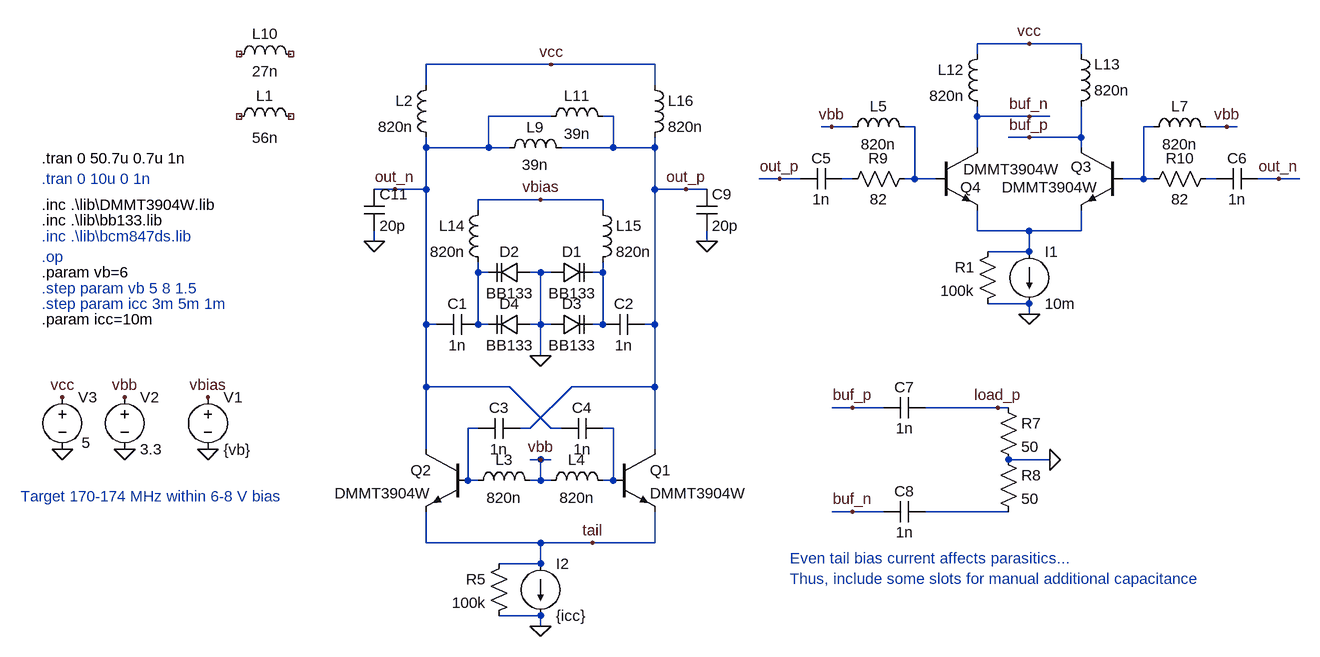
[diagram p0: schematic VHF_VCO_LO_circuit.asc]
VHF_VCO_LO_circuit.asc, the LTspice schematic file:
Version 4.1
SHEET 1 1676 680
WIRE 1120 -400 1040 -400
WIRE 1200 -400 1120 -400
WIRE 1040 -384 1040 -400
WIRE 1200 -384 1200 -400
WIRE 384 -368 192 -368
WIRE 544 -368 384 -368
WIRE 192 -336 192 -368
WIRE 544 -336 544 -368
WIRE 384 -288 288 -288
WIRE 480 -288 464 -288
WIRE 1040 -288 1040 -304
WIRE 1120 -288 1040 -288
WIRE 1152 -288 1120 -288
WIRE 816 -272 800 -272
WIRE 848 -272 816 -272
WIRE 944 -272 928 -272
WIRE 1312 -272 1296 -272
WIRE 1424 -272 1392 -272
WIRE 1440 -272 1424 -272
WIRE 1120 -256 1088 -256
WIRE 1200 -256 1200 -304
WIRE 1200 -256 1120 -256
WIRE 192 -240 192 -256
WIRE 288 -240 288 -288
WIRE 288 -240 192 -240
WIRE 320 -240 288 -240
WIRE 480 -240 480 -288
WIRE 480 -240 400 -240
WIRE 544 -240 544 -256
WIRE 544 -240 480 -240
WIRE 1040 -240 1040 -288
WIRE 1200 -240 1200 -256
WIRE 736 -192 704 -192
WIRE 768 -192 736 -192
WIRE 848 -192 832 -192
WIRE 944 -192 944 -272
WIRE 944 -192 928 -192
WIRE 976 -192 944 -192
WIRE 1296 -192 1296 -272
WIRE 1296 -192 1264 -192
WIRE 1312 -192 1296 -192
WIRE 1408 -192 1392 -192
WIRE 1504 -192 1472 -192
WIRE 1536 -192 1504 -192
WIRE 144 -176 112 -176
WIRE 192 -176 192 -240
WIRE 192 -176 144 -176
WIRE 544 -176 544 -240
WIRE 592 -176 544 -176
WIRE 624 -176 592 -176
WIRE 368 -160 272 -160
WIRE 464 -160 368 -160
WIRE 272 -144 272 -160
WIRE 464 -144 464 -160
WIRE 1040 -112 1040 -144
WIRE 1120 -112 1040 -112
WIRE 1200 -112 1200 -144
WIRE 1200 -112 1120 -112
WIRE 112 -96 112 -112
WIRE 624 -96 624 -112
WIRE 1120 -80 1120 -112
WIRE 1120 -80 1056 -80
WIRE 272 -48 272 -64
WIRE 288 -48 272 -48
WIRE 368 -48 352 -48
WIRE 384 -48 368 -48
WIRE 464 -48 464 -64
WIRE 464 -48 448 -48
WIRE 1120 0 1056 0
WIRE 1120 16 1120 0
WIRE 192 32 192 -176
WIRE 208 32 192 32
WIRE 272 32 272 -48
WIRE 288 32 272 32
WIRE 368 32 368 -48
WIRE 368 32 352 32
WIRE 384 32 368 32
WIRE 464 32 464 -48
WIRE 464 32 448 32
WIRE 544 32 544 -176
WIRE 544 32 528 32
WIRE 368 80 368 32
WIRE 192 128 192 32
WIRE 320 128 192 128
WIRE 544 128 544 32
WIRE 544 128 416 128
WIRE 848 160 816 160
WIRE 896 160 848 160
WIRE 1072 160 960 160
WIRE 1088 160 1072 160
WIRE 272 192 256 192
WIRE 352 192 416 128
WIRE 352 192 336 192
WIRE 384 192 320 128
WIRE 400 192 384 192
WIRE 480 192 464 192
WIRE 192 224 192 128
WIRE 544 224 544 128
WIRE 368 240 352 240
WIRE 384 240 368 240
WIRE 1152 240 1088 240
WIRE 256 272 256 192
WIRE 272 272 256 272
WIRE 368 272 368 240
WIRE 368 272 352 272
WIRE 384 272 368 272
WIRE 480 272 480 192
WIRE 480 272 464 272
WIRE 848 320 816 320
WIRE 896 320 848 320
WIRE 1088 320 960 320
WIRE 192 368 192 320
WIRE 368 368 192 368
WIRE 448 368 368 368
WIRE 544 368 544 320
WIRE 544 368 448 368
WIRE 368 400 368 368
WIRE 368 400 304 400
WIRE 368 480 304 480
WIRE 368 496 368 480
FLAG 368 -160 vbias
FLAG -144 224 0
FLAG -144 144 vbias
FLAG 368 496 0
FLAG 384 -368 vcc
FLAG 368 80 0
FLAG 592 -176 out_p
FLAG 144 -176 out_n
FLAG -272 224 0
FLAG -368 224 0
FLAG -368 144 vcc
FLAG 448 368 tail
FLAG -272 144 vbb
FLAG 1120 16 0
FLAG 1120 -400 vcc
FLAG 1120 -256 buf_p
FLAG 1120 -288 buf_n
FLAG 368 240 vbb
FLAG 736 -192 out_p
FLAG 1504 -192 out_n
FLAG 816 -272 vbb
FLAG 1424 -272 vbb
FLAG 848 160 buf_p
FLAG 848 320 buf_n
FLAG 1152 240 0
FLAG 112 -96 0
FLAG 624 -96 0
FLAG 1072 160 load_p
SYMBOL npn 480 224 R0
SYMATTR InstName Q1
SYMATTR Value DMMT3904W
SYMATTR Prefix XN
SYMBOL varactor 384 -32 R270
WINDOW 0 32 32 VTop 2
WINDOW 3 0 32 VBottom 2
SYMATTR InstName D1
SYMATTR Value BB133
SYMATTR Prefix X
SYMBOL ind -112 -272 R270
WINDOW 0 32 56 VTop 2
WINDOW 3 -1 56 VBottom 2
SYMATTR InstName L1
SYMATTR Value 56n
SYMATTR SpiceLine Rser=3.9 Cpar=313f
SYMBOL varactor 352 -64 R90
WINDOW 0 0 32 VBottom 2
WINDOW 3 32 32 VTop 2
SYMATTR InstName D2
SYMATTR Value BB133
SYMATTR Prefix X
SYMBOL varactor 384 48 R270
WINDOW 0 32 32 VTop 2
WINDOW 3 0 32 VBottom 2
SYMATTR InstName D3
SYMATTR Value BB133
SYMATTR Prefix X
SYMBOL varactor 352 16 R90
WINDOW 0 0 32 VBottom 2
WINDOW 3 32 32 VTop 2
SYMATTR InstName D4
SYMATTR Value BB133
SYMATTR Prefix X
SYMBOL voltage -144 128 R0
WINDOW 123 0 0 Left 0
WINDOW 39 0 0 Left 0
WINDOW 3 24 97 Left 2
SYMATTR Value {vb}
SYMATTR InstName V1
SYMBOL current 368 400 R0
WINDOW 123 0 0 Left 0
WINDOW 39 0 0 Left 0
SYMATTR InstName I2
SYMATTR Value {icc}
SYMBOL res 320 384 M0
SYMATTR InstName R5
SYMATTR Value 100k
SYMBOL cap 272 16 R90
WINDOW 3 32 32 VTop 2
WINDOW 0 0 32 VBottom 2
SYMATTR Value 1n
SYMATTR InstName C1
SYMATTR SpiceLine Rser=20m Lser=281p
SYMBOL cap 528 16 R90
WINDOW 3 32 32 VTop 2
WINDOW 0 0 32 VBottom 2
SYMATTR Value 1n
SYMATTR InstName C2
SYMATTR SpiceLine Rser=20m Lser=281p
SYMBOL voltage -368 128 R0
WINDOW 3 30 86 Left 2
WINDOW 123 0 0 Left 0
WINDOW 39 0 0 Left 0
SYMATTR Value 5
SYMATTR InstName V3
SYMBOL voltage -272 128 R0
WINDOW 123 0 0 Left 0
WINDOW 39 0 0 Left 0
SYMATTR InstName V2
SYMATTR Value 3.3
SYMBOL current 1120 -80 R0
WINDOW 123 0 0 Left 0
WINDOW 39 0 0 Left 0
SYMATTR InstName I1
SYMATTR Value 10m
SYMBOL res 1072 -96 M0
SYMATTR InstName R1
SYMATTR Value 100k
SYMBOL cap 336 176 R90
WINDOW 3 32 32 VTop 2
WINDOW 0 0 32 VBottom 2
SYMATTR Value 1n
SYMATTR InstName C3
SYMATTR SpiceLine Rser=20m Lser=281p
SYMBOL cap 464 176 R90
WINDOW 3 32 32 VTop 2
WINDOW 0 0 32 VBottom 2
SYMATTR Value 1n
SYMATTR InstName C4
SYMATTR SpiceLine Rser=20m Lser=281p
SYMBOL cap 832 -208 R90
WINDOW 3 32 32 VTop 2
WINDOW 0 0 32 VBottom 2
SYMATTR Value 1n
SYMATTR InstName C5
SYMATTR SpiceLine Rser=20m Lser=281p
SYMBOL cap 1472 -208 R90
WINDOW 3 32 32 VTop 2
WINDOW 0 0 32 VBottom 2
SYMATTR Value 1n
SYMATTR InstName C6
SYMATTR SpiceLine Rser=20m Lser=281p
SYMBOL res 1072 144 R0
SYMATTR InstName R7
SYMATTR Value 50
SYMBOL res 1072 224 R0
SYMATTR InstName R8
SYMATTR Value 50
SYMBOL ind 304 -224 R270
WINDOW 0 32 56 VTop 2
WINDOW 3 5 56 VBottom 2
SYMATTR InstName L9
SYMATTR Value 39n
SYMATTR SpiceLine Rser=3 Cpar=287f
SYMBOL cap 960 144 R90
WINDOW 3 32 32 VTop 2
WINDOW 0 0 32 VBottom 2
SYMATTR Value 1n
SYMATTR InstName C7
SYMATTR SpiceLine Rser=20m Lser=281p
SYMBOL cap 960 304 R90
WINDOW 3 32 32 VTop 2
WINDOW 0 0 32 VBottom 2
SYMATTR Value 1n
SYMATTR InstName C8
SYMATTR SpiceLine Rser=20m Lser=281p
SYMBOL ind -112 -368 R270
WINDOW 0 32 56 VTop 2
WINDOW 3 5 56 VBottom 2
SYMATTR InstName L10
SYMATTR Value 27n
SYMATTR SpiceLine Rser=2.3 Cpar=235f
SYMBOL npn 256 224 M0
SYMATTR InstName Q2
SYMATTR Value DMMT3904W
SYMATTR Prefix XN
SYMBOL npn 1264 -240 M0
WINDOW 0 48 29 Left 2
WINDOW 3 37 61 Left 2
SYMATTR InstName Q3
SYMATTR Value DMMT3904W
SYMATTR Prefix XN
SYMBOL npn 976 -240 R0
WINDOW 0 38 61 Left 2
WINDOW 3 43 33 Left 2
SYMATTR InstName Q4
SYMATTR Value DMMT3904W
SYMATTR Prefix XN
SYMBOL cap 608 -176 R0
SYMATTR InstName C9
SYMATTR Value 20p
SYMBOL ind 368 -272 R270
WINDOW 0 32 56 VTop 2
WINDOW 3 5 56 VBottom 2
SYMATTR InstName L11
SYMATTR Value 39n
SYMATTR SpiceLine Rser=3 Cpar=287f
SYMBOL cap 96 -176 R0
SYMATTR InstName C11
SYMATTR Value 20p
SYMBOL res 944 -208 R90
WINDOW 0 0 56 VBottom 2
WINDOW 3 32 56 VTop 2
SYMATTR InstName R9
SYMATTR Value 82
SYMBOL res 1408 -208 R90
WINDOW 0 0 56 VBottom 2
WINDOW 3 32 56 VTop 2
SYMATTR InstName R10
SYMATTR Value 82
SYMBOL ind 528 -352 R0
SYMATTR InstName L16
SYMATTR Value 820n
SYMATTR SpiceLine Rser=1.6 Cpar=252f
SYMBOL ind 208 -352 M0
SYMATTR InstName L2
SYMATTR Value 820n
SYMATTR SpiceLine Rser=1.6 Cpar=252f
SYMBOL ind 368 288 M270
WINDOW 0 32 56 VTop 2
WINDOW 3 5 56 VBottom 2
SYMATTR InstName L3
SYMATTR Value 820n
SYMATTR SpiceLine Rser=1.6 Cpar=252f
SYMBOL ind 480 288 M270
WINDOW 0 32 56 VTop 2
WINDOW 3 5 56 VBottom 2
SYMATTR InstName L4
SYMATTR Value 820n
SYMATTR SpiceLine Rser=1.6 Cpar=252f
SYMBOL ind 944 -256 M270
WINDOW 0 32 56 VTop 2
WINDOW 3 5 56 VBottom 2
SYMATTR InstName L5
SYMATTR Value 820n
SYMATTR SpiceLine Rser=1.6 Cpar=252f
SYMBOL ind 1408 -256 M270
WINDOW 0 32 56 VTop 2
WINDOW 3 5 56 VBottom 2
SYMATTR InstName L7
SYMATTR Value 820n
SYMATTR SpiceLine Rser=1.6 Cpar=252f
SYMBOL ind 1056 -400 M0
SYMATTR InstName L12
SYMATTR Value 820n
SYMATTR SpiceLine Rser=1.6 Cpar=252f
SYMBOL ind 1184 -288 M180
WINDOW 0 36 80 Left 2
WINDOW 3 36 40 Left 2
SYMATTR InstName L13
SYMATTR Value 820n
SYMATTR SpiceLine Rser=1.6 Cpar=252f
SYMBOL ind 288 -160 M0
SYMATTR InstName L14
SYMATTR Value 820n
SYMATTR SpiceLine Rser=1.6 Cpar=252f
SYMBOL ind 448 -160 R0
SYMATTR InstName L15
SYMATTR Value 820n
SYMATTR SpiceLine Rser=1.6 Cpar=252f
TEXT -400 -104 Left 2 ;.inc .\\lib\\bcm847ds.lib
TEXT -400 -72 Left 2 ;.op
TEXT -400 -128 Left 2 !.inc .\\lib\\bb133.lib
TEXT -432 296 Left 2 ;Target 170-174 MHz within 6-8 V bias
TEXT -400 -48 Left 2 !.param vb=6
TEXT -400 -224 Left 2 !.tran 0 50.7u 0.7u 1n
TEXT -400 -192 Left 2 ;.tran 0 10u 0 1n
TEXT -400 -24 Left 2 ;.step param vb 5 8 1.5
TEXT -400 -152 Left 2 !.inc .\\lib\\DMMT3904W.lib
TEXT 752 392 Left 2 ;Even tail bias current affects parasitics...\nThus, include some slots for manual additional capacitance
TEXT -400 0 Left 2 ;.step param icc 3m 5m 1m
TEXT -400 24 Left 2 !.param icc=10m

The netlist it stands for:
* VHF_VCO_LO_circuit.asc
X§Q1 out_p N009 tail DMMT3904W  ; pins C B E
X§D1 0 N007 BB133  ; pins + -
L1 NC_01 NC_02 56n Rser=3.9 Cpar=313f
X§D2 0 N006 BB133  ; pins + -
X§D3 0 N007 BB133  ; pins + -
X§D4 0 N006 BB133  ; pins + -
V1 vbias 0 {vb}
I2 tail 0 {icc}
R5 tail 0 100k
C1 N006 out_n 1n Rser=20m Lser=281p
C2 out_p N007 1n Rser=20m Lser=281p
V3 vcc 0 5
V2 vbb 0 3.3
I1 N005 0 10m
R1 N005 0 100k
C3 out_p N008 1n Rser=20m Lser=281p
C4 N009 out_n 1n Rser=20m Lser=281p
C5 N003 out_p 1n Rser=20m Lser=281p
C6 out_n N004 1n Rser=20m Lser=281p
R7 load_p 0 50
R8 0 N010 50
L9 out_n out_p 39n Rser=3 Cpar=287f
C7 load_p buf_p 1n Rser=20m Lser=281p
C8 N010 buf_n 1n Rser=20m Lser=281p
L10 NC_03 NC_04 27n Rser=2.3 Cpar=235f
X§Q2 out_n N008 tail DMMT3904W  ; pins C B E
X§Q3 buf_p N002 N005 DMMT3904W  ; pins C B E
X§Q4 buf_n N001 N005 DMMT3904W  ; pins C B E
C9 out_p 0 20p
L11 out_n out_p 39n Rser=3 Cpar=287f
C11 out_n 0 20p
R9 N001 N003 82
R10 N004 N002 82
L16 vcc out_p 820n Rser=1.6 Cpar=252f
L2 vcc out_n 820n Rser=1.6 Cpar=252f
L3 vbb N008 820n Rser=1.6 Cpar=252f
L4 N009 vbb 820n Rser=1.6 Cpar=252f
L5 N001 vbb 820n Rser=1.6 Cpar=252f
L7 vbb N002 820n Rser=1.6 Cpar=252f
L12 vcc buf_n 820n Rser=1.6 Cpar=252f
L13 buf_p vcc 820n Rser=1.6 Cpar=252f
L14 vbias N006 820n Rser=1.6 Cpar=252f
L15 vbias N007 820n Rser=1.6 Cpar=252f
* .inc .\lib\bcm847ds.lib
* .op
.inc .\lib\bb133.lib
* Target 170-174 MHz within 6-8 V bias
.param vb=6
.tran 0 50.7u 0.7u 1n
* .tran 0 10u 0 1n
* .step param vb 5 8 1.5
.inc .\lib\DMMT3904W.lib
* Even tail bias current affects parasitics...
* Thus, include some slots for manual additional capacitance
* .step param icc 3m 5m 1m
.param icc=10m
.backanno
.end